# Altium schematic sheet battery-voltage.SchDoc
size A4; SheetNumber: 8; SheetTotal: 15
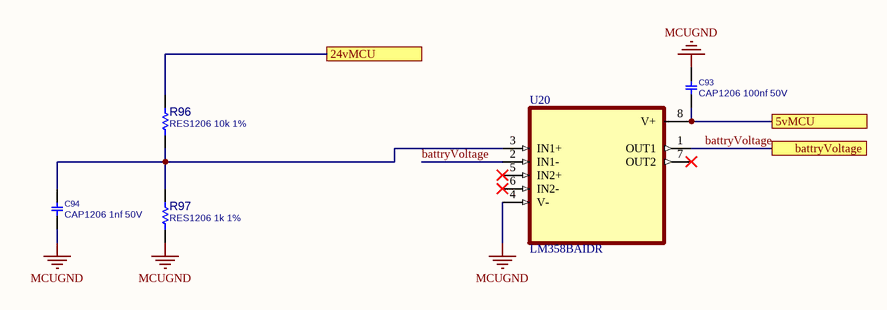
[diagram p0: battery-voltage.SchDoc]

## Parts
C93  CAP1206 100nf 50V  [C1206]
C94  CAP1206 1nf 50V  [C1206]
R96  RES1206 10k 1%  [R1206]
R97  RES1206 1k 1%  [R1206]
U20  LM358BAIDR  [SOIC127P599X175-8N]

## Ports
5vMCU, 24vMCU, battryVoltage

## Nets
MCUGND: C93.1 C94.2 R97.2 U20.4(V-)
5vMCU: C93.2 U20.8(V+) ; port 5vMCU
24vMCU: R96.1 ; port 24vMCU
battryVoltage: U20.1(OUT1) U20.2(IN1-) ; port battryVoltage
NetC94_1: C94.1 R96.2 R97.1 U20.3(IN1+)

Not connected (* = marked no-connect by the designer): U20 5(IN2+)* 6(IN2-)* 7(OUT2)*

## Library data of the parts
C93 C94 = CAP_SMD_MLCC_1206: CAP, MLCC; PARAM: -, -%; MANF_P#: MANF_PART#; PARAM2: -V; PRICE: 100= 1$; MANF: -; ASSEMBLY: ASSEMBLY
R96 R97 = RES_SMD_1206: RESISTOR, SMD; PARAM: 1%, 0.25W; DESC: DESCRIPTION; DIST#: MOUSER; MANF_P#: -; MANF: -; ASSEMBLY: ASSEMBLY; PRICE: -; PARAM2: -
U20 = LM358BAIDR: Dual, 36-V, 1.2-MHz, 2-mV offset voltage operational amplifier; MF: Texas Instruments; SnapEDA_Link: https://www.snapeda.com/parts/LM358BAIDR/Texas+Instruments/view-part/?ref=snap; Package: SOIC-8 Texas Instruments; Value: *; MP: LM358BAIDR; Check_prices: https://www.snapeda.com/parts/LM358BAIDR/Texas+Instruments/view-part/?ref=eda